# Altium schematic sheet PowerPanel_0_Top.SchDoc
size 594 x 420 mm; SheetNumber: 1; SheetTotal: 6
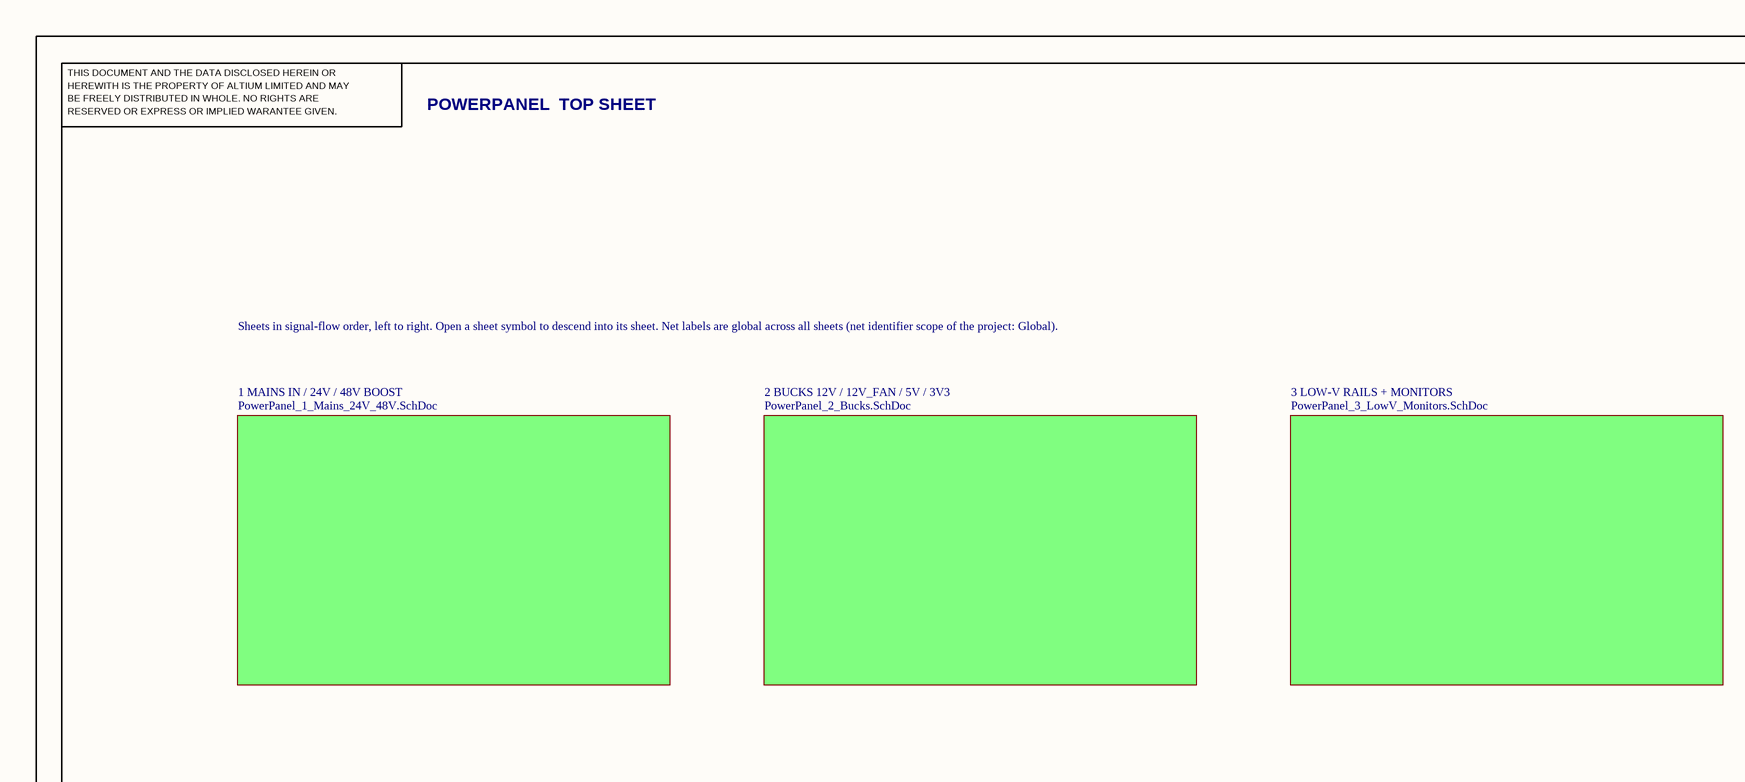
[diagram p0: PowerPanel_0_Top.SchDoc, top left]
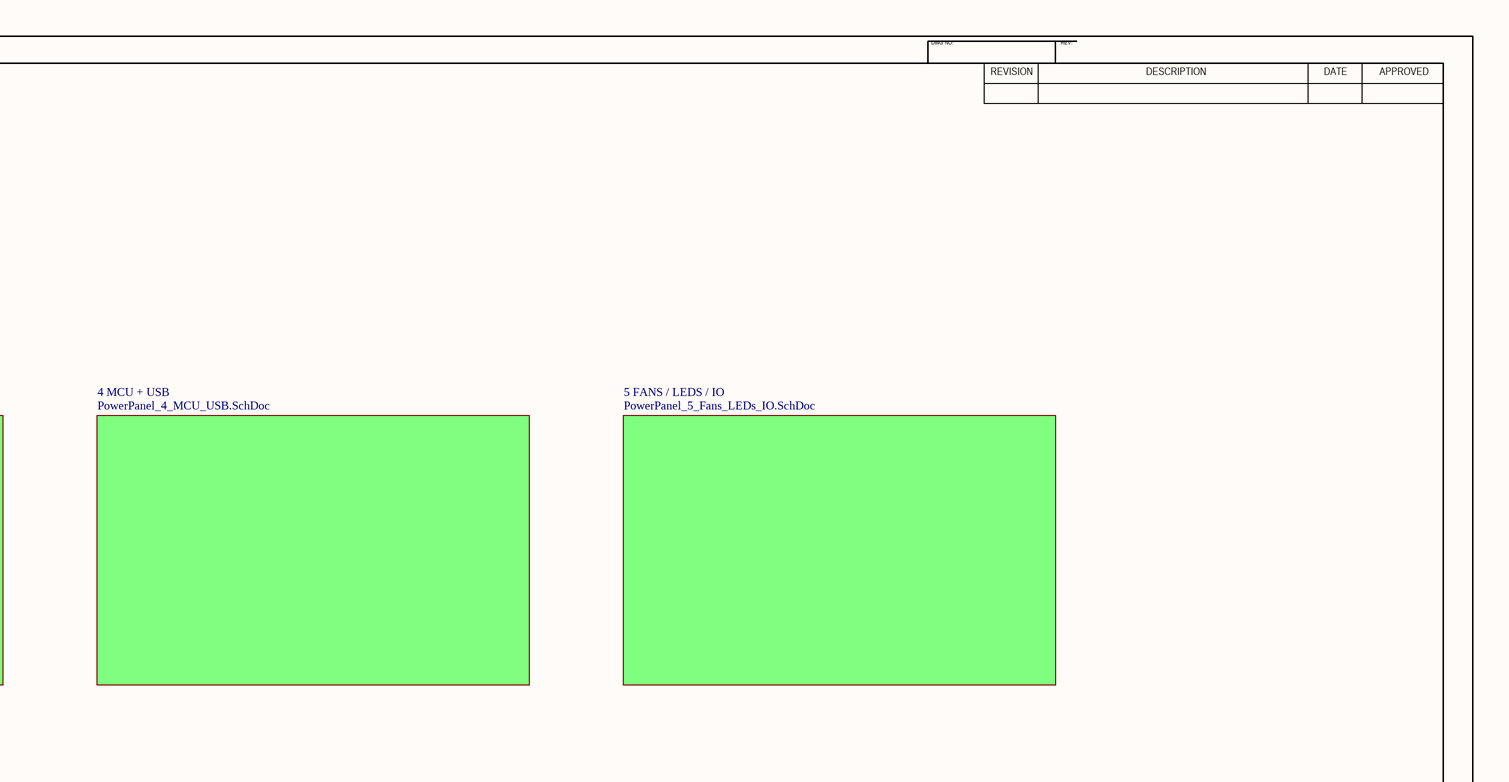
[diagram p1: PowerPanel_0_Top.SchDoc, top right]
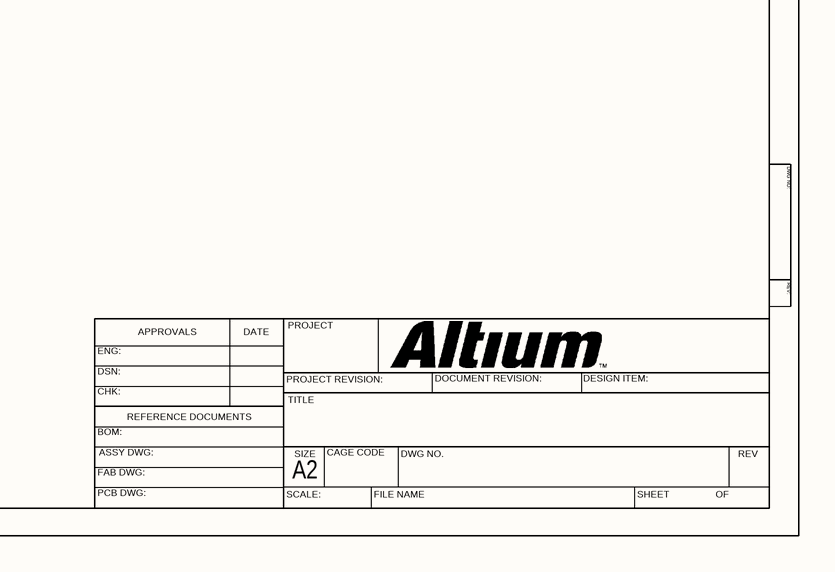
[diagram p2: PowerPanel_0_Top.SchDoc, bottom right]

## Sub-sheets
1 MAINS IN / 24V / 48V BOOST = PowerPanel_1_Mains_24V_48V.SchDoc: no entries
2 BUCKS 12V / 12V_FAN / 5V / 3V3 = PowerPanel_2_Bucks.SchDoc: no entries
3 LOW-V RAILS + MONITORS = PowerPanel_3_LowV_Monitors.SchDoc: no entries
4 MCU + USB = PowerPanel_4_MCU_USB.SchDoc: no entries
5 FANS / LEDS / IO = PowerPanel_5_Fans_LEDs_IO.SchDoc: no entries

## Notes on the sheet
- DWG NO:
- REV:
- THIS DOCUMENT AND THE DATA DISCLOSED HEREIN OR
- HEREWITH IS THE PROPERTY OF ALTIUM LIMITED AND MAY
- BE FREELY DISTRIBUTED IN WHOLE. NO RIGHTS ARE
- RESERVED OR EXPRESS OR IMPLIED WARANTEE GIVEN.
- POWERPANEL  TOP SHEET
- REVISION
- DESCRIPTION
- DATE
- APPROVED
- Sheets in signal-flow order, left to right. Open a sheet symbol to descend into its sheet. Net labels are global across all sheets (net identifier scope of the project: Global).
- ENG:
- APPROVALS
- PROJECT
- DSN:
- CHK:
- REFERENCE DOCUMENTS
- PROJECT REVISION:
- TITLE
- DOCUMENT REVISION:
- DESIGN ITEM:
- BOM:
- FAB DWG:
- PCB DWG:
- ASSY DWG:
- SCALE:
- A2
- SIZE
- CAGE CODE
- FILE NAME
- DWG NO.
- SHEET
- OF
- REV